# Altium schematic sheet Opamp_Sheet.SchDoc
size 420 x 297 mm
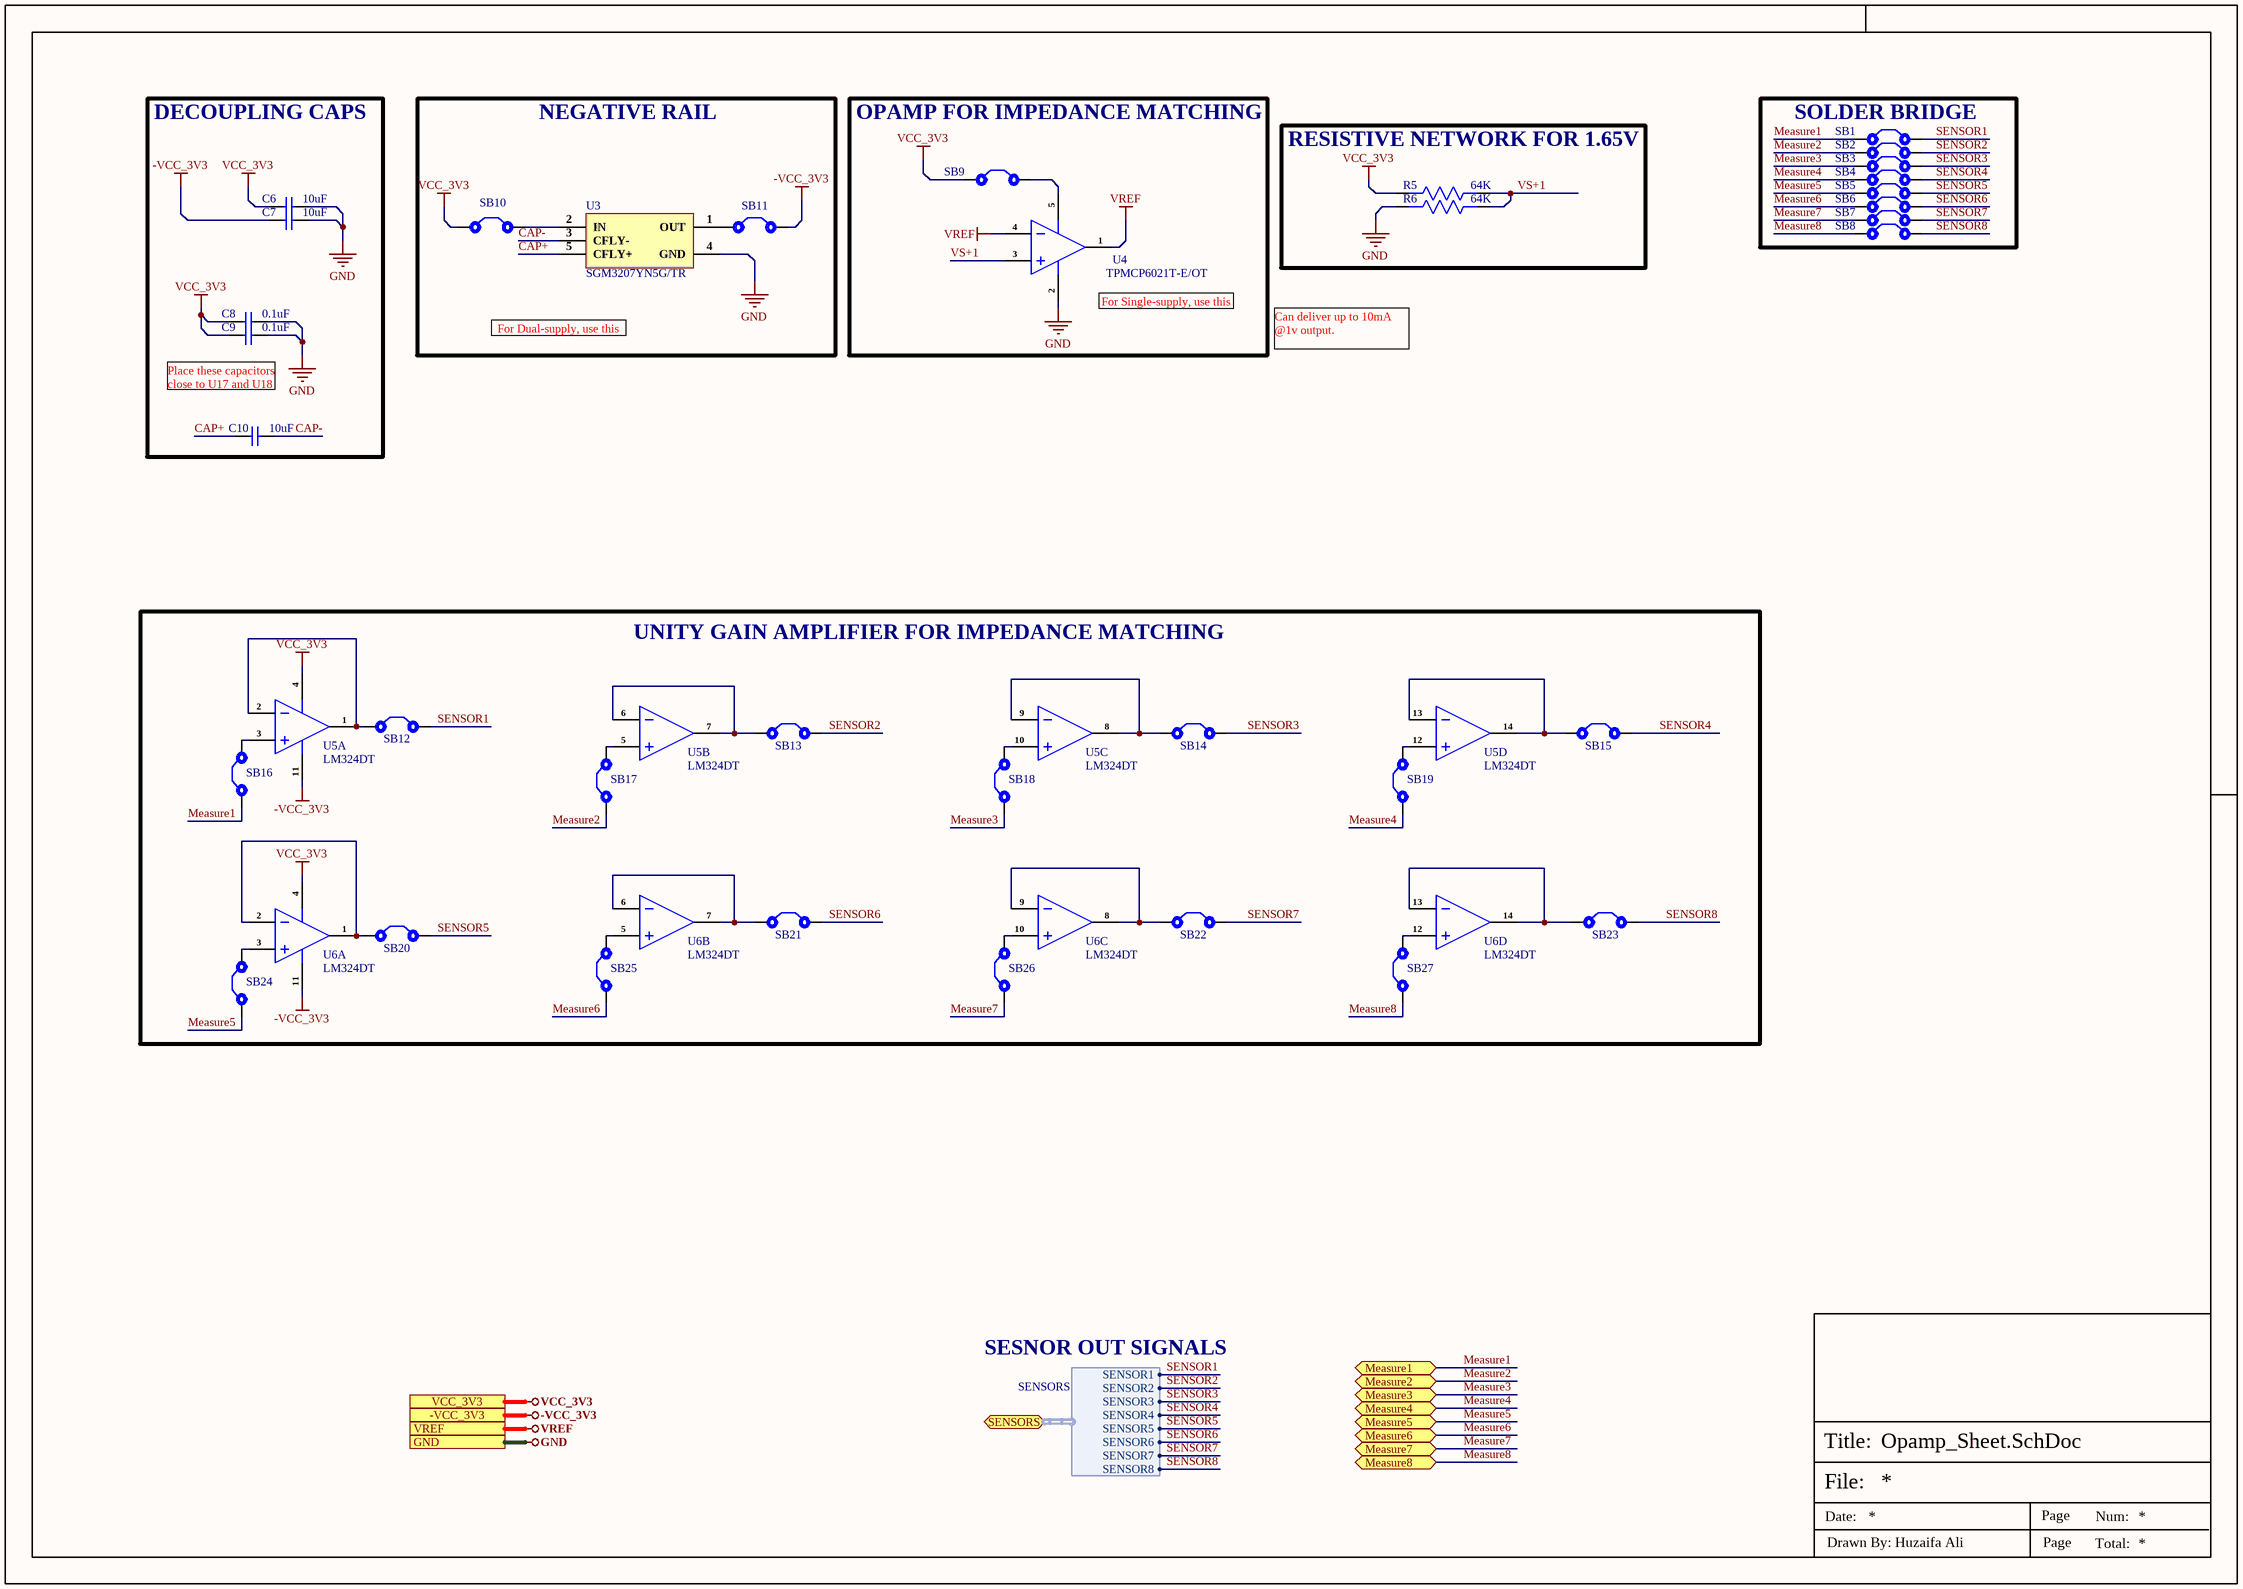
[diagram p0: Opamp_Sheet.SchDoc]

## Parts
C6  10uF  [Cap-0603]
C7  10uF  [Cap-0603]
C8  0.1uF  [Cap-0402]
C9  0.1uF  [Cap-0402]
C10  10uF  [Cap-0603]
R5  64K  [Res-0603]
R6  64K  [Res-0603]
SB1  Solder Bridge 0402  [Solder Bridge 0402]  (value not drawn)  (no BOM)
SB2  Solder Bridge 0402  [Solder Bridge 0402]  (value not drawn)  (no BOM)
SB3  Solder Bridge 0402  [Solder Bridge 0402]  (value not drawn)  (no BOM)
SB4  Solder Bridge 0402  [Solder Bridge 0402]  (value not drawn)  (no BOM)
SB5  Solder Bridge 0402  [Solder Bridge 0402]  (value not drawn)  (no BOM)
SB6  Solder Bridge 0402  [Solder Bridge 0402]  (value not drawn)  (no BOM)
SB7  Solder Bridge 0402  [Solder Bridge 0402]  (value not drawn)  (no BOM)
SB8  Solder Bridge 0402  [Solder Bridge 0402]  (value not drawn)  (no BOM)
SB9  Solder Bridge 0402  [Solder Bridge 0402]  (value not drawn)  (no BOM)
SB10  Solder Bridge 0402  [Solder Bridge 0402]  (value not drawn)  (no BOM)
SB11  Solder Bridge 0402  [Solder Bridge 0402]  (value not drawn)  (no BOM)
SB12  Solder Bridge 0402  [Solder Bridge 0402]  (value not drawn)  (no BOM)
SB13  Solder Bridge 0402  [Solder Bridge 0402]  (value not drawn)  (no BOM)
SB14  Solder Bridge 0402  [Solder Bridge 0402]  (value not drawn)  (no BOM)
SB15  Solder Bridge 0402  [Solder Bridge 0402]  (value not drawn)  (no BOM)
SB16  Solder Bridge 0402  [Solder Bridge 0402]  (value not drawn)  (no BOM)
SB17  Solder Bridge 0402  [Solder Bridge 0402]  (value not drawn)  (no BOM)
SB18  Solder Bridge 0402  [Solder Bridge 0402]  (value not drawn)  (no BOM)
SB19  Solder Bridge 0402  [Solder Bridge 0402]  (value not drawn)  (no BOM)
SB20  Solder Bridge 0402  [Solder Bridge 0402]  (value not drawn)  (no BOM)
SB21  Solder Bridge 0402  [Solder Bridge 0402]  (value not drawn)  (no BOM)
SB22  Solder Bridge 0402  [Solder Bridge 0402]  (value not drawn)  (no BOM)
SB23  Solder Bridge 0402  [Solder Bridge 0402]  (value not drawn)  (no BOM)
SB24  Solder Bridge 0402  [Solder Bridge 0402]  (value not drawn)  (no BOM)
SB25  Solder Bridge 0402  [Solder Bridge 0402]  (value not drawn)  (no BOM)
SB26  Solder Bridge 0402  [Solder Bridge 0402]  (value not drawn)  (no BOM)
SB27  Solder Bridge 0402  [Solder Bridge 0402]  (value not drawn)  (no BOM)
U3  SGM3207YN5G/TR  [SOT-23-5]
U4  TPMCP6021T-E/OT  [SOT-23-5]
U5  LM324DT  [14-SO]  (parts A,B,C,D of 4)
U6  LM324DT  [14-SO]  (parts A,B,C,D of 4)

## Blocks framed on the sheet
DECOUPLING CAPS: C6-C10
NEGATIVE RAIL: SB10 SB11 U3
OPAMP FOR IMPEDANCE MATCHING: SB9 U4
SOLDER BRIDGE: SB1-SB8
RESISTIVE NETWORK FOR 1.65V: R5 R6
UNITY GAIN AMPLIFIER FOR IMPEDANCE MATCHING: SB12-SB27 U5 U6

## Ports
-VCC_3V3, GND, Measure1 (bidir), Measure2 (bidir), Measure3 (bidir), Measure4 (bidir), Measure5 (bidir), Measure6 (bidir), Measure7 (bidir), Measure8 (bidir), SENSORS (bidir, harness SENSORS), VCC_3V3, VREF

## Harnesses
SENSORS: SENSOR1, SENSOR2, SENSOR3, SENSOR4, SENSOR5, SENSOR6, SENSOR7, SENSOR8

## Nets
-VCC_3V3: C7.1 SB11.2 U5.11(VCC-) U6.11(VCC-) ; port -VCC_3V3
GND: C6.2 C7.2 C8.2 C9.2 R6.2 U3.4(GND) U4.2(V-) ; port GND
VCC_3V3: C6.1 C8.1 C9.1 R5.2 SB9.1 SB10.1 U5.4(VCC+) U6.4(VCC+) ; port VCC_3V3
VREF: U4.1(OUT) U4.4(IN-) ; port VREF
CAP+: C10.1 U3.5(CFLY+)
CAP-: C10.2 U3.3(CFLY-)
Measure1: SB1.1 SB16.1 ; port Measure1
Measure2: SB2.1 SB17.1 ; port Measure2
Measure3: SB3.1 SB18.1 ; port Measure3
Measure4: SB4.1 SB19.1 ; port Measure4
Measure5: SB5.1 SB24.1 ; port Measure5
Measure6: SB6.1 SB25.1 ; port Measure6
Measure7: SB7.1 SB26.1 ; port Measure7
Measure8: SB8.1 SB27.1 ; port Measure8
SENSOR1: SB1.2 SB12.2 ; port SENSORS.SENSOR1
SENSOR2: SB2.2 SB13.2 ; port SENSORS.SENSOR2
SENSOR3: SB3.2 SB14.2 ; port SENSORS.SENSOR3
SENSOR4: SB4.2 SB15.2 ; port SENSORS.SENSOR4
SENSOR5: SB5.2 SB20.2 ; port SENSORS.SENSOR5
SENSOR6: SB6.2 SB21.2 ; port SENSORS.SENSOR6
SENSOR7: SB7.2 SB22.2 ; port SENSORS.SENSOR7
SENSOR8: SB8.2 SB23.2 ; port SENSORS.SENSOR8
VS+1: R5.1 R6.1 U4.3(IN+)
NetSB9_2: SB9.2 U4.5(V+)
NetSB10_2: SB10.2 U3.2(IN)
NetSB11_1: SB11.1 U3.1(OUT)
NetSB12_1: SB12.1 U5.1(1OUT) U5.2(IN-)
NetSB13_1: SB13.1 U5.6(2IN-) U5.7(2OUT)
NetSB14_1: SB14.1 U5.8(3OUT) U5.9(3IN-)
NetSB15_1: SB15.1 U5.13(4IN-) U5.14(4OUT)
NetSB16_2: SB16.2 U5.3(IN+)
NetSB17_2: SB17.2 U5.5(2IN+)
NetSB18_2: SB18.2 U5.10(3IN+)
NetSB19_2: SB19.2 U5.12(4IN+)
NetSB20_1: SB20.1 U6.1(1OUT) U6.2(IN-)
NetSB21_1: SB21.1 U6.6(2IN-) U6.7(2OUT)
NetSB22_1: SB22.1 U6.8(3OUT) U6.9(3IN-)
NetSB23_1: SB23.1 U6.13(4IN-) U6.14(4OUT)
NetSB24_2: SB24.2 U6.3(IN+)
NetSB25_2: SB25.2 U6.5(2IN+)
NetSB26_2: SB26.2 U6.10(3IN+)
NetSB27_2: SB27.2 U6.12(4IN+)

## Notes on the sheet
- (near U4) For Single-supply, use this
- Place these capacitors close to U17 and U18
- For Dual-supply, use this
- Can deliver up to 10mA @1v output.
- SESNOR OUT SIGNALS
- File:
- Title:
- Date:
- Page
- Num:
- Total:
- Drawn By: Huzaifa Ali

## Library data of the parts
C6 C7 C10 = CL10A106MA8NRNC: CAP CER 10UF 25V X5R 0603; Manufacturer: Samsung; Tolerance: 20%; Supplier 1: Avnet; Manufacturer Part Number: CL10A106MA8NRNC; RoHS: Yes; Category: Ceramic Capacitors; Pricing 1: 4000=0.03753, 8000=0.03700, 16000=0.03595, 24000=0.03515, 32000=0.03383, 40000=0.03304, 400000=0.03225 (USD); Mount: Surface Mount; Case/Package: 0603; Case Code (Metric): 1608; Case Code (Imperial): 0603; Contact Plating: Tin; Min Operating Temperature: -55°C; Max Operating Temperature: 85°C; Package Quantity: 1; Packaging: Tape and Reel; Capacitance: 10uF; Voltage Rating: 25V; Dielectric: X5R; Termination: Wraparound; Series: CL; Construction: Flat; Length: 0.063inch; Width: 0.031inch; Thickness: 0.035inch; Lead Free: Lead Free; RoHS Compliant: Yes; ComponentLink1URL: https://datasheet.ciiva.com/25766/cl10a106ma8nrnc-25766562.pdf?src-supplier=Digi-Key; ComponentLink1Description: https://datasheet.ciiva.com/25766/cl10a106ma8nrnc-25766562.pdf?src-supplier=Digi-Key; Supplier Part Number 1: CL10A106MA8NRNC; LCSC Part Number: C96446
C8 C9 = GRM155R71H104ME14D: CAP CER 0.1UF 50V X7R 0402; Manufacturer: Murata; Tolerance: 20%; Capacitance: 100nF; Item Type: Capacitor; Supplier 1: Avnet; Manufacturer Part Number: GRM155R71H104ME14D; Stock 1: 100000; Pricing 1: 10000=0.00444, 20000=0.00420, 40000=0.00396, 60000=0.00372, 80000=0.00348, 100000=0.00324, 1000000=0.00300 (USD); Mount: Surface Mount; Case/Package: 0402; Min Operating Temperature: -55°C; Max Operating Temperature: 125°C; Packaging: Cut Tape; Voltage Rating: 50V; Length: 0.039inch; Width: 0.02inch; Thickness: 0.022inch; ComponentLink1URL: http://www.mouser.com/ds/2/281/c02e-2905.pdf?src-supplier=Mouser; ComponentLink1Description: http://www.mouser.com/ds/2/281/c02e-2905.pdf?src-supplier=Mouser; ComponentLink2URL: http://search.murata.co.jp/Ceramy/image/img/A01X/G101/ENG/GRM155R71H104ME14-01.pdf?src-supplier=Digi-Key; ComponentLink2Description: http://search.murata.co.jp/Ceramy/image/img/A01X/G101/ENG/GRM155R71H104ME14-01.pdf?src-supplier=Digi-Key; ComponentLink3URL: http://psearch.en.murata.com/capacitor/product/GRM155R71H104ME14%23.pdf?src-supplier=Avnet; ComponentLink3Description: http://psearch.en.murata.com/capacitor/product/GRM155R71H104ME14%23.pdf?src-supplier=Avnet; Supplier Part Number 1: GRM155R71H104ME14D; RoHS: Yes; Category: Ceramic Capacitors; RoHS Compliant: Yes; LCSC Part Number: C182412
R5 R6 = ARG03DTC6402N: 1/10W Thin Film Resistor 75V ±0.5% ±25ppm/℃ -55℃~+155℃ 64kΩ 0603 Chip Resistor - Surface Mount ROHS; Manufacturer: iking Tech; Value: 64K; Manufacturer Part Number: ARG03DTC6402N; Footprint: 0603; ComponentLink1Description: LCSC; ComponentLink1URL: https://lcsc.com/product-detail/Chip-Resistor-Surface-Mount_Viking-Tech-ARG03DTC6402N_C2902643.html; LCSC Part Number: C2902643; Item Type: Resistor
SB1-SB27 = Solder Bridge 0402: Solder Bridge ON; Manufacturer Part Number: Solder Bridge 0402; Item Type: Solder Bridge
U3 = SGM3207YN5G/TR: NO Charge pump 1 -5.5V~-1.4V 1.4V~5.5V 60mA 19kHz SOT-23-5 DC-DC Converters ROHS; Manufacturer: SG Micro; Item Type: IC; Supplier 1: Avnet; Manufacturer Part Number: SGM3207YN5G/TR; RoHS: No; Category: Uncategorized; Pricing 1: 3000=0.38750, 6000=0.36250, 12000=0.33750, 18000=0.32500, 24000=0.31250, 30000=0.31250, 300000=0.30500 (USD); LCSC Part Number: C80403; Supplier Part Number 1: SGM3207YN5G/TR
U4 = TPMCP6021T-E/OT: SOT-23-5 Operational Amplifier ROHS; Manufacturer: TECH PUBLIC; Item Type: IC; Manufacturer Part Number: TPMCP6021T-E/OT; LCSC Part Number: C2923365; ComponentLink1Description: LCSC; ComponentLink1URL: https://www.lcsc.com/product-detail/Operational-Amplifier_TECH-PUBLIC-TPMCP6021T-E-OT_C2923365.html
U5 U6 = LM324DT: IC OPAMP GP 1.3MHZ 14SO; Manufacturer: STMicroelectronics; Max Supply Voltage: 30V; Min Supply Voltage: 3V; Min Dual Supply Voltage: 1.5V; Max Dual Supply Voltage: 15V; Voltage Gain: 100dB; Slew Rate: 0.4V/µs; Common Mode Rejection Ratio: 70dB; Nominal Supply Current: 1.2mA; Input Offset Voltage (Vos): 7mV; Input Bias Current: 150nA; Number of Circuits: 4; Output Current per Channel: 40mA; Dual Supply Voltage: 12V; Supply Type: Single,Dual; Input Voltage Noise Density: 40nV/sqrt Hz; Max Power Dissipation: 400mW; Supplier 1: Arrow Electronics; Manufacturer Part Number: LM324DT; RoHS: Yes; LCSC Part Number: C71035; Stock 1: 287500; Pricing 1: 2500=0.18900 (USD); Mount: Surface Mount; Case/Package: SO; Number of Pins: 14; Contact Plating: Tin,Matte; Weight: 0.009143oz; Min Operating Temperature: 0°C; Max Operating Temperature: 70°C; Gain Bandwidth Product: 1.3MHz; Packaging: Cut Tape; Package Quantity: 2500; Operating Supply Current: 1.2mA; Operating Supply Voltage: 15V; Number of Channels: 4; Output Current: 40mA; Number of Elements: 4; Series: LM324; Technology: BIPOLAR; Bandwidth: 1.3MHz; Number of Amplifiers: 4; Unity Gain Bandwidth Product: 1.3MHz; Item Type: IC; Width: 4mm; Height: 1.65mm; Radiation Hardening: No; RoHS Compliant: Yes; Lead Free: Lead Free; REACH SVHC: No SVHC; ComponentLink1URL: https://datasheet.ciiva.com/4758/cd00000457-103203-4758032.pdf?src-supplier=Mouser; ComponentLink1Description: https://datasheet.ciiva.com/4758/cd00000457-103203-4758032.pdf?src-supplier=Mouser; ComponentLink2URL: https://datasheet.ciiva.com/8008/1834360-8008827.pdf?src-supplier=Element14; ComponentLink2Description: https://datasheet.ciiva.com/8008/1834360-8008827.pdf?src-supplier=Element14; ComponentLink3URL: https://datasheet.ciiva.com/8008/1834360-8008490.pdf?src-supplier=Element14; ComponentLink3Description: https://datasheet.ciiva.com/8008/1834360-8008490.pdf?src-supplier=Element14; ComponentLink4URL: https://datasheet.ciiva.com/28630/1834360-28630538.pdf?src-supplier=Element14; ComponentLink4Description: https://datasheet.ciiva.com/28630/1834360-28630538.pdf?src-supplier=Element14; ComponentLink5URL: https://datasheet.ciiva.com/1795/cd00000457-1795560.pdf?src-supplier=Digi-Key; ComponentLink5Description: https://datasheet.ciiva.com/1795/cd00000457-1795560.pdf?src-supplier=Digi-Key; ComponentLink6URL: https://datasheet.ciiva.com/1795/cd00000457-1795559.pdf?src-supplier=Digi-Key; ComponentLink6Description: https://datasheet.ciiva.com/1795/cd00000457-1795559.pdf?src-supplier=Digi-Key; ComponentLink7URL: https://datasheet.ciiva.com/1795/cd00000457-1795561.pdf?src-supplier=Digi-Key; ComponentLink7Description: https://datasheet.ciiva.com/1795/cd00000457-1795561.pdf?src-supplier=Digi-Key; ComponentLink8URL: https://datasheet.ciiva.com/16375/cd00000457-16375528.pdf?src-supplier=Future+Electronics; ComponentLink8Description: https://datasheet.ciiva.com/16375/cd00000457-16375528.pdf?src-supplier=Future+Electronics; Supplier Part Number 1: LM324DT